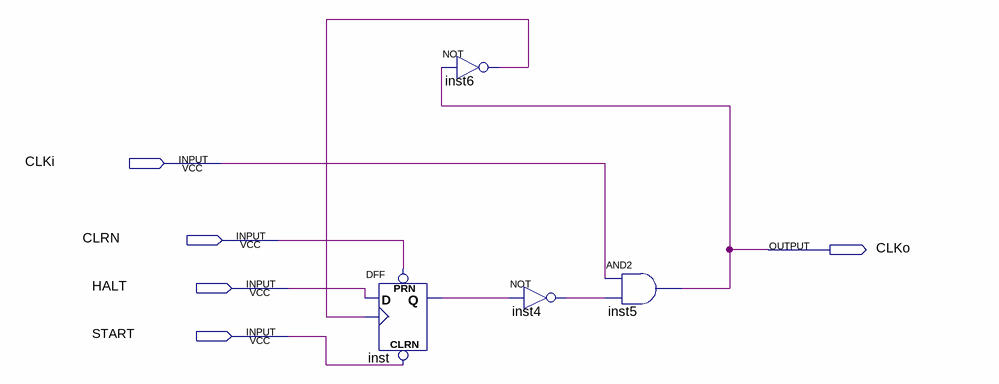
[diagram p0: schematic sheet]
// Quartus schematic start_end_circuit.bdf as structural Verilog: 4 symbols, 5 pins
module start_end_circuit (
  input  CLKi,
  input  CLRN,
  input  HALT,
  input  START,
  output CLKo
);

  wire inst4_out, inst6_out, inst_q;

  DFF inst (.CLRN(START), .CLK(inst6_out), .D(HALT), .PRN(CLRN), .Q(inst_q));
  not inst6 (inst6_out, CLKo);
  not inst4 (inst4_out, inst_q);
  and inst5 (CLKo, CLKi, inst4_out);
endmodule
